# EasyEDA Pro project ProPrj_esp32_home_v1_2026-11-28.9.epro

# Board baseboard
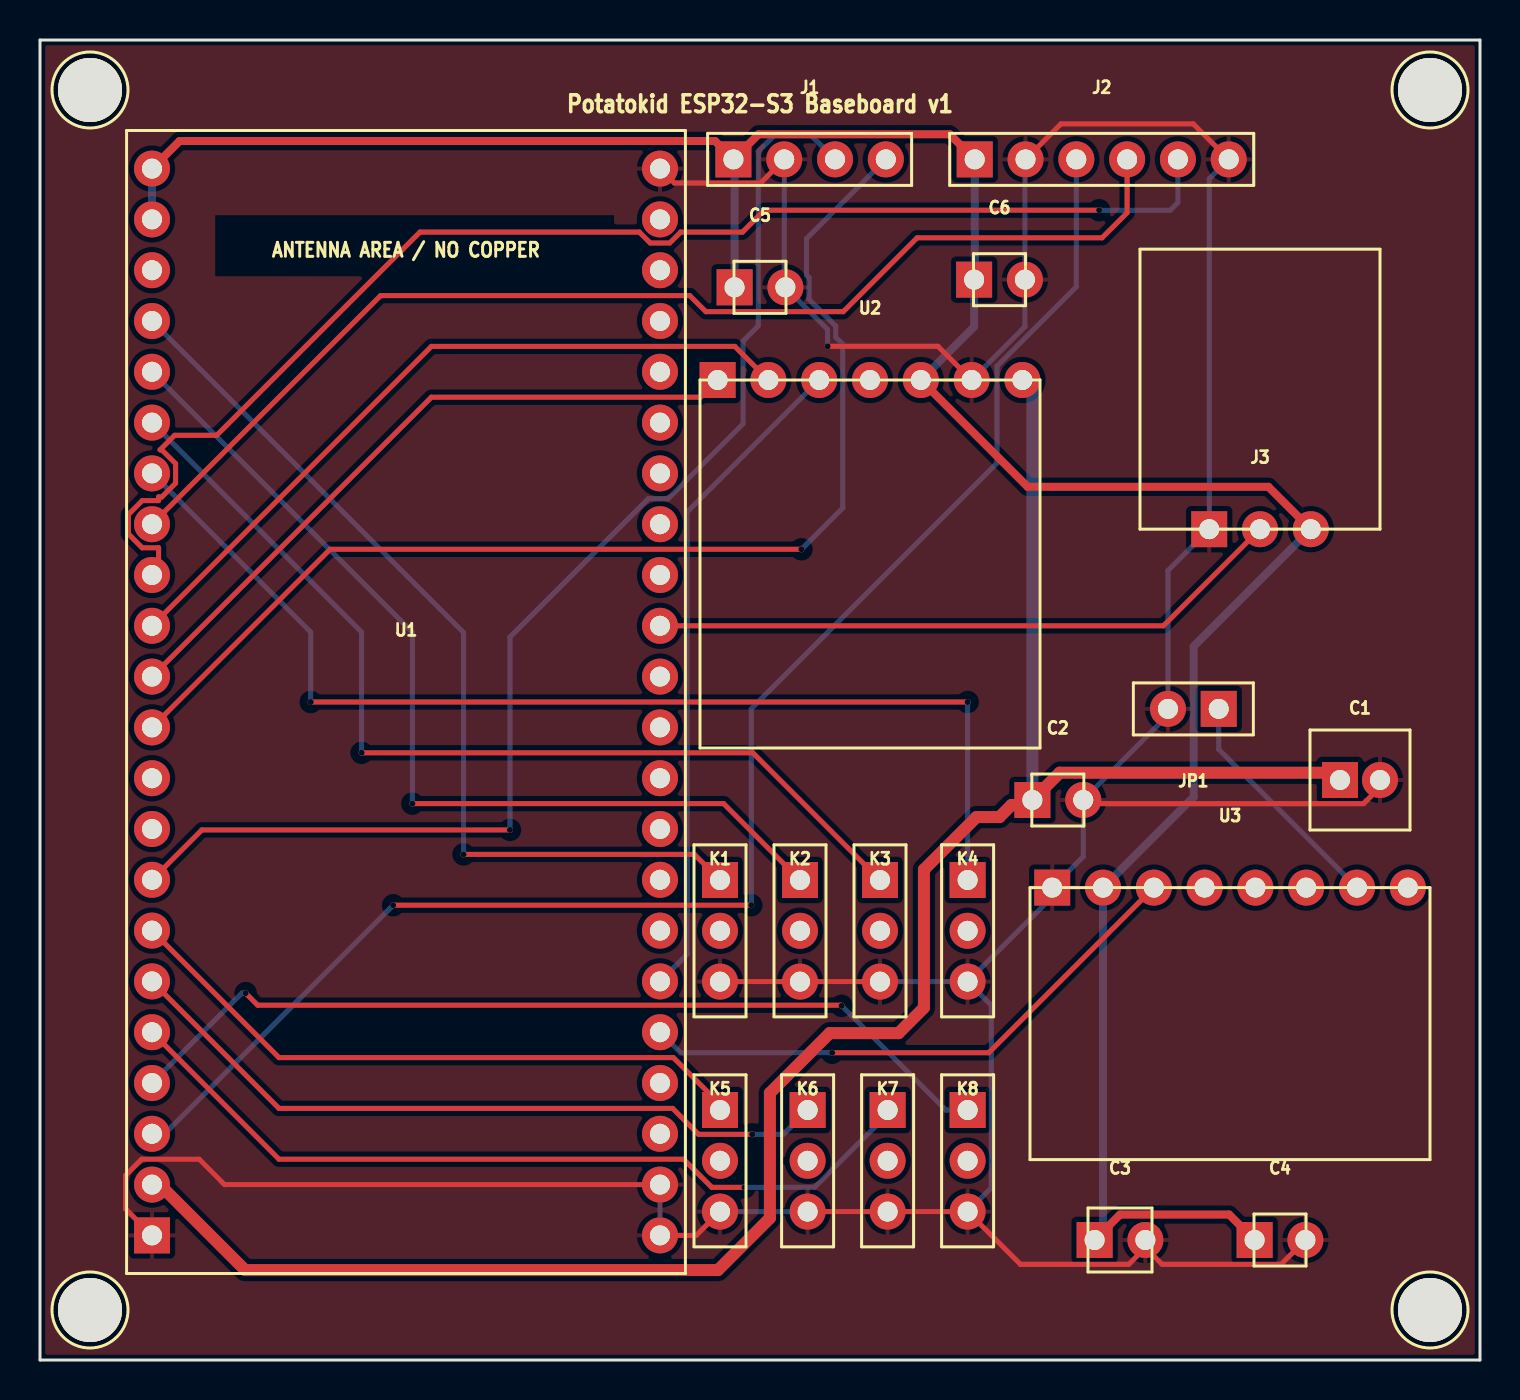
[diagram p0: board, top side]
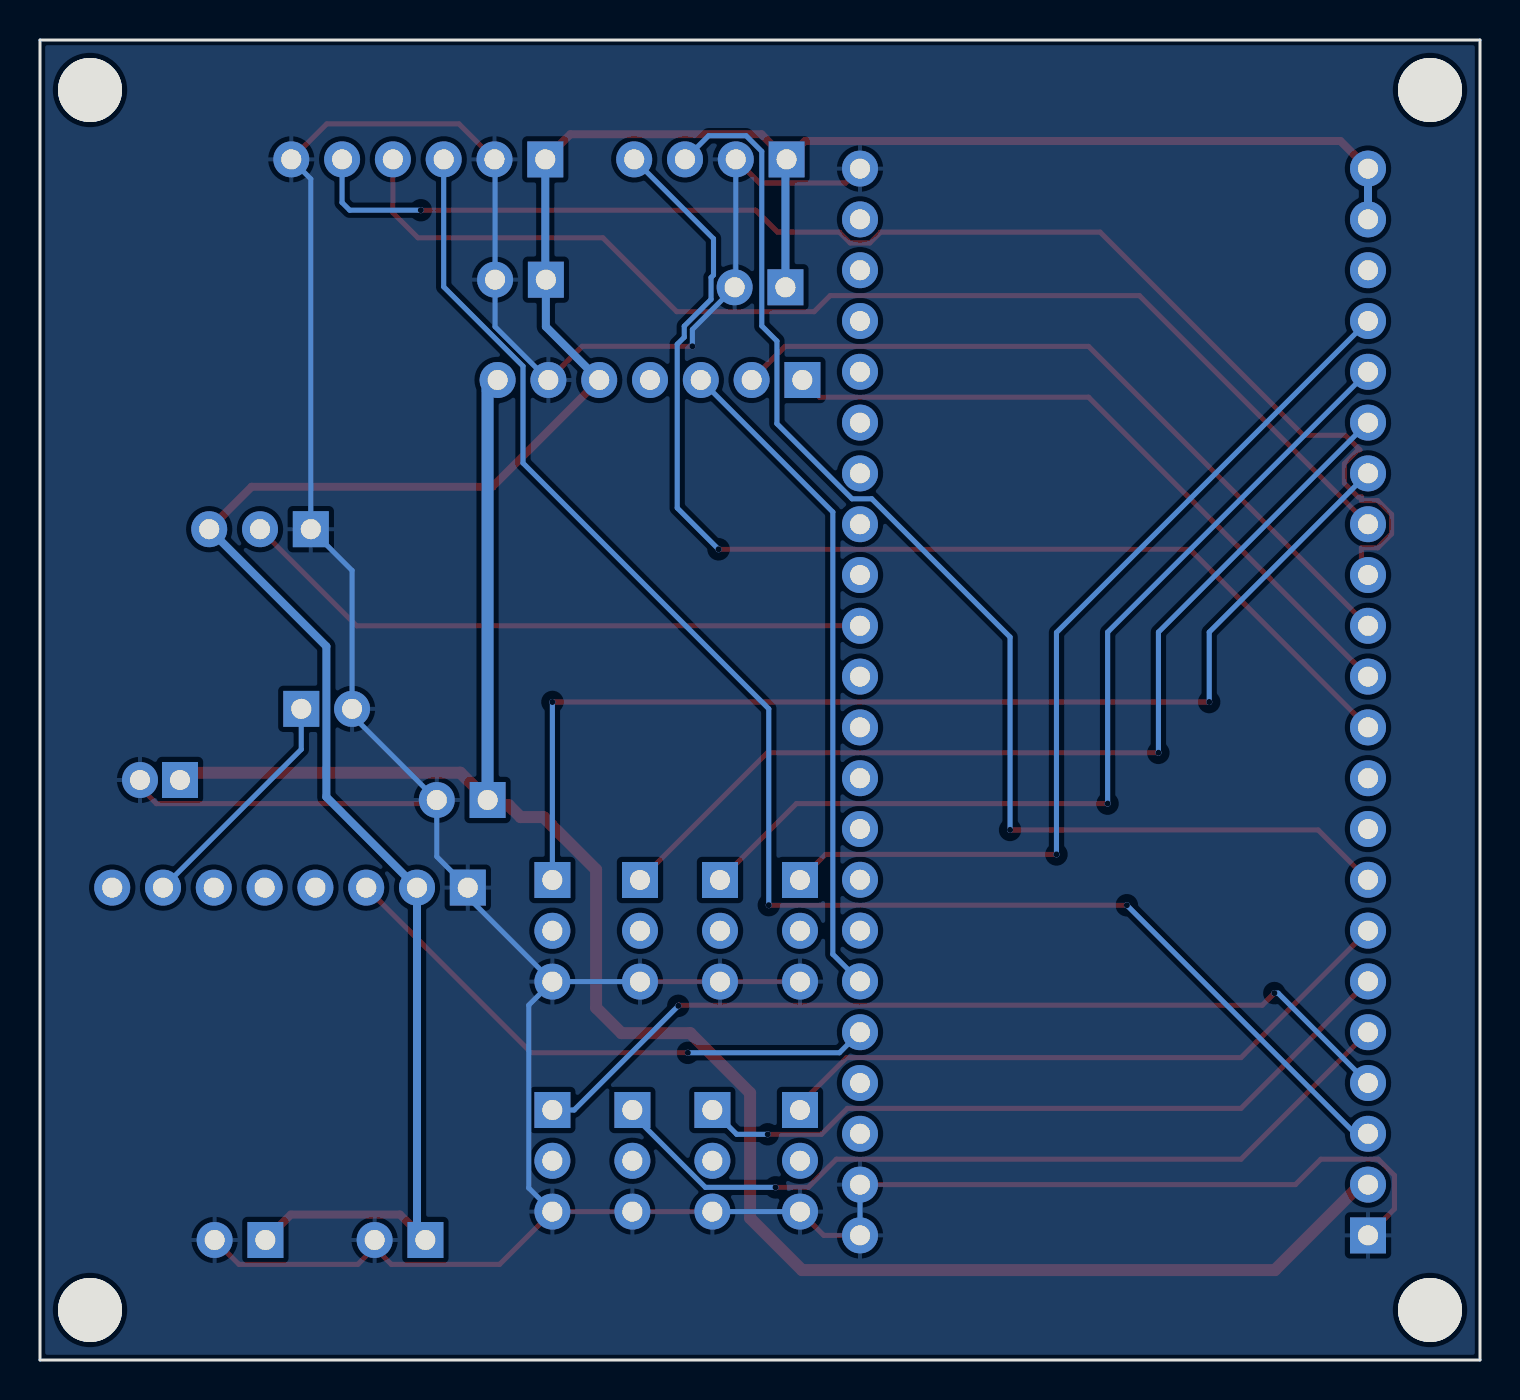
[diagram p1: board, bottom side, seen from below]

Outline 72 x 66 mm; copper layers: Top Layer, Bottom Layer. Coordinates in mm from the lower left corner of the outline.
Outline path: 0,66 72,66 72,0 0,0 0,66
Stack: Top Layer 0.035mm / Bottom Layer 0.035mm

## Design rules (mm)
spacing copperThickness1oz (default): track to track 0.152, other pairs 0.152 to 0.3
track width copperThickness1oz (default): min 0.127, default 0.254, max 2.54
track width 5v: min 0.6, default 0.6, max 2.54
track width 3.3v: min 0.4, default 0.4, max 2.54
differential pair differentialPair (default): width min 0.127, default 2.54, max 2.54; gap min 0.127, default 0.152
net 3V3 uses 3.3v
net 5V uses 5v
net GND uses copperRegion

## Placement (name value [footprint] x y rotation side)
C1  470uF/10V  [pk:470uF/10V]  66 29 0 top
C2  0.1uF  [pk:0.1uF]  50.89 28 0 top
C3  10uF  [pk:10uF]  54 6 0 top
C4  0.1uF  [pk:0.1uF]  62 6 0 top
C5  0.1uF  [pk:0.1uF]  36 53.64 0 top
C6  0.1uF  [pk:0.1uF]  47.98 54.02 0 top
H1  M3  [pk:MountingHole-M3]  2.5 63.5 0 top
H2  M3  [pk:MountingHole-M3]  69.5 63.5 0 top
H3  M3  [pk:MountingHole-M3]  2.5 2.5 0 top
H4  M3  [pk:MountingHole-M3]  69.5 2.5 0 top
J1  OLED-4P  [pk:OLED-4P]  38.48 60.03 0 top
J2  INMP441-6P  [pk:INMP441-6P]  53.09 60.03 0 top
J3  PIR-SR301  [pk:PIR-SR301]  61 41.54 0 top
JP1  RF-KEY-JUMP  [pk:RF-KEY-JUMP]  57.67 32.56 180 top
K1  KEY-3P  [pk:KEY-3P]  34 21.46 0 top
K2  KEY-3P  [pk:KEY-3P]  38 21.46 0 top
K3  KEY-3P  [pk:KEY-3P]  42 21.46 0 top
K4  KEY-3P  [pk:KEY-3P]  46.38 21.46 0 top
K5  KEY-3P  [pk:KEY-3P]  34 9.96 0 top
K6  KEY-3P  [pk:KEY-3P]  38.38 9.96 0 top
K7  KEY-3P  [pk:KEY-3P]  42.38 9.96 0 top
K8  KEY-3P  [pk:KEY-3P]  46.38 9.96 0 top
U1  ESP32-S3-DevKitC-1  [pk:ESP32-S3-DevKitC-1]  18.3 32.9 0 top
U2  MAX98357A  [pk:MAX98357A]  41.5 49 0 top
U3  ASL430D-433RX  [pk:ASL430D-433RX]  59.5 23.62 0 top

## Footprints (pads in the part's own frame, mm; a bottom-side part is the same pattern mirrored in y, then rotated)
pk:0.1uF
  rect 1.8x1.8 hole 1: 1(-1.27,0)
  round 1.8 hole 1: 2(1.27,0)
pk:10uF
  rect 1.8x1.8 hole 1: 1(-1.27,0)
  round 1.8 hole 1: 2(1.27,0)
pk:470uF/10V
  rect 1.8x1.8 hole 1: 1(-1,0)
  round 1.8 hole 1: 2(1,0)
pk:ASL430D-433RX
  rect 1.8x1.8 hole 1: 1(-8.89,0)
  round 1.8 hole 1: 2(-6.35,0) 3(-3.81,0) 4(-1.27,0) 5(1.27,0) 6(3.81,0) 7(6.35,0) 8(8.89,0)
pk:ESP32-S3-DevKitC-1
  rect 1.8x1.8 hole 1: 1(-12.7,-26.67)
  round 1.8 hole 1: 2(-12.7,-24.13) 3(-12.7,-21.59) 4(-12.7,-19.05) 5(-12.7,-16.51) 6(-12.7,-13.97) 7(-12.7,-11.43) 8(-12.7,-8.89) 9(-12.7,-6.35) 10(-12.7,-3.81) 11(-12.7,-1.27) 12(-12.7,1.27) 13(-12.7,3.81) 14(-12.7,6.35) 15(-12.7,8.89) 16(-12.7,11.43) 17(-12.7,13.97) 18(-12.7,16.51) 19(-12.7,19.05) 20(-12.7,21.59) 21(-12.7,24.13) 22(-12.7,26.67) 23(12.7,-26.67) 24(12.7,-24.13) 25(12.7,-21.59) 26(12.7,-19.05) 27(12.7,-16.51) 28(12.7,-13.97) 29(12.7,-11.43) 30(12.7,-8.89) 31(12.7,-6.35) 32(12.7,-3.81) 33(12.7,-1.27) 34(12.7,1.27) 35(12.7,3.81) 36(12.7,6.35) 37(12.7,8.89) 38(12.7,11.43) 39(12.7,13.97) 40(12.7,16.51) 41(12.7,19.05) 42(12.7,21.59) 43(12.7,24.13) 44(12.7,26.67)
pk:INMP441-6P
  rect 1.8x1.8 hole 1: 1(-6.35,0)
  round 1.8 hole 1: 2(-3.81,0) 3(-1.27,0) 4(1.27,0) 5(3.81,0) 6(6.35,0)
pk:KEY-3P
  rect 1.8x1.8 hole 1: 1(0,2.54)
  round 1.8 hole 1: 2(0,0) 3(0,-2.54)
pk:MAX98357A
  rect 1.8x1.8 hole 1: 1(-7.62,0)
  round 1.8 hole 1: 2(-5.08,0) 3(-2.54,0) 4(0,0) 5(2.54,0) 6(5.08,0) 7(7.62,0)
pk:MountingHole-M3
  round 3.2 hole 3.2: (0,0)
pk:OLED-4P
  rect 1.8x1.8 hole 1: 1(-3.81,0)
  round 1.8 hole 1: 2(-1.27,0) 3(1.27,0) 4(3.81,0)
pk:PIR-SR301
  rect 1.8x1.8 hole 1: 1(-2.54,0)
  round 1.8 hole 1: 2(0,0) 3(2.54,0)
pk:RF-KEY-JUMP
  rect 1.8x1.8 hole 1: 1(-1.27,0)
  round 1.8 hole 1: 2(1.27,0)

## Nets
3V3: C3.1 C4.1 C5.1 C6.1 J1.1 J2.1 J3.3 U1.21 U1.22 U2.5 U3.2
5V: C1.1 C2.1 U1.2 U2.7
GND: C1.2 C2.2 C3.2 C4.2 C5.2 C6.2 J1.2 J2.2 J2.6 J3.1 JP1.2 K1.3 K2.3 K3.3 K4.3 K5.3 K6.3 K7.3 K8.3 U1.1 U1.23 U1.24 U1.44 U2.6 U3.1
AMP_BCLK: U1.13 U2.2
AMP_DIN: U1.28 U2.3
AMP_LRC: U1.12 U2.1
KEY1: K1.1 U1.19
KEY2: K2.1 U1.18
KEY3: K3.1 U1.17
KEY4: K4.1 U1.16
KEY5: K5.1 U1.7
KEY6: K6.1 U1.6
KEY7: K7.1 U1.5
KEY8: K8.1 U1.4
MIC_SCK: J2.3 U1.3
MIC_SD: J2.5 U1.14
MIC_WS: J2.4 U1.15
PIR_OUT: J3.2 U1.35
RF_ANT: U3.8
RF_D0: U1.27 U3.3
RF_KEY: JP1.1 U3.7
SCL: J1.3 U1.8
SDA: J1.4 U1.11

Pads without a net: K1 2; K2 2; K3 2; K4 2; K5 2; K6 2; K7 2; K8 2; U1 9 10 20 25 26 29 30 31 32 33 34 36 37 38 39 40 41 42 43; U2 4; U3 4 5 6

## Via types
v1: diameter 0.305, hole 0.61, Top Layer to Bottom Layer, 16 vias

## Routing (per net, layer and track width the routed paths; a pad name or vN(x,y) marks a point on that pad's centre or on a via; arc(x,y) is an arc through that point)
3V3: length 135.9
  Top Layer w0.4: U2.5 49.38,43.66 61.42,43.66 J3.3 ; J2.1 45.48,61.29 35.93,61.29 J1.1 33.75,60.95 6.98,60.95 U1.22 ; C4.1 59.46,7.27 54,7.27 C3.1
  Bottom Layer w0.4: J1.1 34.73,59.97 C5.1 ; J2.1 46.74,54.05 C6.1 46.71,51.67 U2.5 ; J3.3 57.68,35.68 57.68,28.15 U3.2 53.15,6.42 C3.1 ; U1.21 U1.22
5V: length 100.3
  Top Layer w0.6: 49.62,27.75 48.57,27.75 47.97,27.15 46.82,27.15 44.2,24.52 44.2,17.61 42.93,16.34 39.49,16.34 36.49,13.35 36.49,7.09 33.9,4.5 10.25,4.5 6.23,8.52 5.6,8.52 ; C2.1 50.99,29.36 64.64,29.36 C1.1
  Bottom Layer w0.6: U2.7 49.62,48.5 C2.1
GND: length 205
  Top Layer w0.254: C4.2 62.05,4.78 56.11,4.78 55.27,5.62 ; C2.2 52.34,27.82 66.18,27.82 67,28.64 C1.2 ; U1.44 31.72,58.85 36.03,58.85 37.21,60.03 ; 55.27,5.62 54.43,4.78 49.02,4.78 K8.3 K7.3 K6.3 ; 55.27,5.62 C3.2 ; J2.6 57.66,61.81 51.05,61.81 J2.2 ; K3.3 K2.3 K1.3 ; K5.3 32.81,6.23 U1.23 ; U1.24 9.23,8.77 7.96,10.04 5.09,10.04 4.28,9.23 4.28,7.55 U1.1 ; U2.6 44.9,50.69 v1(39.38,50.69)
  Bottom Layer w0.254: K5.3 K6.3 ; 37.21,60.03 37.21,53.69 C5.2 39.38,51.52 v1(39.38,50.69) ; U1.23 U1.24 ; K3.3 K4.3 ; K4.3 47.56,17.74 47.56,8.6 K8.3 ; K4.3 50.61,23.15 U3.1 52.16,25.17 C2.2 56.4,32.24 JP1.2 56.4,39.48 J3.1 58.46,59.06 J2.6 ; U2.6 49.25,51.67 C6.2 49.25,60 J2.2
AMP_BCLK: length 37.3
  Top Layer w0.254: U2.2 34.74,50.68 19.57,50.68 U1.13
AMP_DIN: length 33.4
  Bottom Layer w0.254: U2.3 32.36,42.4 32.36,20.29 U1.28
AMP_LRC: length 34.4
  Top Layer w0.254: U2.1 33.02,48.14 19.57,48.14 U1.12
KEY1: length 46.5
  Top Layer w0.254: K1.1 32.72,25.28 v1(21.18,25.28)
  Bottom Layer w0.254: U1.19 21.18,36.37 v1(21.18,25.28)
KEY2: length 47.9
  Top Layer w0.254: K2.1 34.18,27.82 v1(18.62,27.82)
  Bottom Layer w0.254: U1.18 18.62,36.39 v1(18.62,27.82)
KEY3: length 49.4
  Top Layer w0.254: K3.1 35.64,30.36 v1(16.08,30.36)
  Bottom Layer w0.254: v1(16.08,30.36) 16.08,36.39 U1.17
KEY4: length 56.5
  Top Layer w0.254: v1(13.54,32.9) v1(46.38,32.9)
  Bottom Layer w0.254: K4.1 v1(46.38,32.9) ; U1.16 13.54,36.39 v1(13.54,32.9)
KEY5: length 32.3
  Top Layer w0.254: K5.1 34,12.79 31.67,15.12 11.95,15.12 U1.7
KEY6: length 36.5
  Top Layer w0.254: v1(35.61,11.28) 32.93,11.28 31.63,12.58 11.95,12.58 U1.6
  Bottom Layer w0.254: v1(35.61,11.28) 37.16,11.28 K6.1
KEY7: length 41.7
  Top Layer w0.254: U1.5 11.95,10.04 32.18,10.04 33.59,8.63 v1(35.22,8.63)
  Bottom Layer w0.254: K7.1 42.38,12.28 38.73,8.63 v1(35.22,8.63)
KEY8: length 45.1
  Top Layer w0.254: v1(40.08,17.71) 40.05,17.74 10.88,17.74 v1(10.28,18.34)
  Bottom Layer w0.254: v1(40.08,17.71) 45.29,12.5 K8.1 ; v1(10.28,18.34) 10.09,18.34 U1.4
MIC_SCK: length 78.7
  Top Layer w0.254: v1(35.56,22.74) v1(17.66,22.74)
  Bottom Layer w0.254: v1(35.56,22.74) 35.56,32.56 47.85,44.85 47.85,49.69 51.82,53.66 J2.3 ; v1(17.66,22.74) 6.23,11.31 U1.3
MIC_SD: length 68
  Top Layer w0.254: v1(52.96,57.49) 36.22,57.49 35.12,56.39 32.03,56.39 31.49,55.85 30.51,55.85 29.97,56.39 19,56.39 8.84,46.23 6.73,46.23 6,45.51 6.09,45.51 6.78,44.82 6.78,43.84 6.09,43.15 5.93,43.15 5.93,42.97 5.11,42.97 4.42,42.28 4.42,41.3 5.11,40.61 5.93,40.61 5.93,39.58 U1.14
  Bottom Layer w0.254: J2.5 56.9,57.87 56.51,57.49 v1(52.96,57.49)
MIC_WS: length 58.5
  Top Layer w0.254: U1.15 17.03,53.22 32.49,53.22 33.29,52.42 40.16,52.42 43.86,56.11 53.1,56.11 54.36,57.36 J2.4
PIR_OUT: length 32
  Top Layer w0.254: U1.35 56.17,36.71 J3.2
RF_D0: length 28.5
  Top Layer w0.254: v1(39.61,15.36) 47.43,15.36 U3.3
  Bottom Layer w0.254: v1(39.61,15.36) 32.03,15.36 U1.27
RF_KEY: length 11.8
  Bottom Layer w0.254: U3.7 58.94,30.53 JP1.1
SCL: length 63.2
  Top Layer w0.254: U1.8 8.09,26.5 v1(23.5,26.5)
  Bottom Layer w0.254: J1.3 38.57,61.21 36.7,61.21 35.91,60.43 35.91,51.7 35.15,50.95 35.15,46.82 31.4,43.06 30.41,43.06 23.5,36.15 v1(23.5,26.5)
SDA: length 58.9
  Top Layer w0.254: v1(38.07,40.54) 14.51,40.54 U1.11
  Bottom Layer w0.254: J1.4 38.32,56.06 38.32,54.25 38.45,54.12 38.45,53.03 39.79,51.69 39.79,51.14 40.14,50.79 40.14,42.6 v1(38.07,40.54)

## Copper pours and planes (outline as drawn; the poured copper is in the pictures)
GND on Top Layer: -4.57,68.29 77.47,68.29 77.47,-4.99 -4.57,-4.99
GND on Bottom Layer: -2.29,66.51 75.95,66.51 75.95,-3.34 -2.29,-3.34

## Text on the board
Top Silkscreen Layer: ANTENNA AREA / NO COPPER | Potatokid ESP32-S3 Baseboard v1
